# Altium schematic sheet U_eMMC.SchDoc
size A4; SheetNumber: 5; SheetTotal: 9
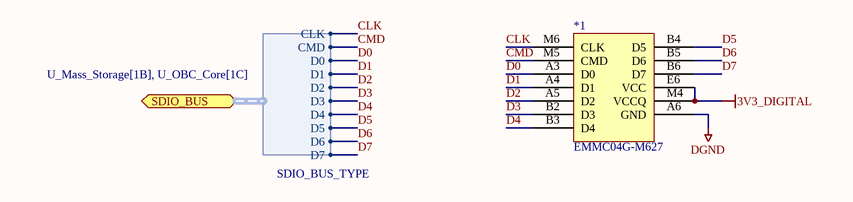
[diagram p0: U_eMMC.SchDoc]

## Parts
*1  EMMC04G-M627

## Ports
SDIO_BUS (bidir, harness SDIO_BUS_TYPE, see U_Mass_Storage[1B], U_OBC_Core[1C])

## Harnesses
SDIO_BUS_TYPE: CLK, CMD, D0, D1, D2, D3, D4, D5, D6, D7

## Nets
3V3_DIGITAL: *1.E6(VCC) *1.M4(VCCQ)
DGND: *1.A6(GND)
CLK: *1.M6(CLK) ; port SDIO_BUS.CLK
CMD: *1.M5(CMD) ; port SDIO_BUS.CMD
D0: *1.A3(D0) ; port SDIO_BUS.D0
D1: *1.A4(D1) ; port SDIO_BUS.D1
D2: *1.A5(D2) ; port SDIO_BUS.D2
D3: *1.B2(D3) ; port SDIO_BUS.D3
D4: *1.B3(D4) ; port SDIO_BUS.D4
D5: *1.B4(D5) ; port SDIO_BUS.D5
D6: *1.B5(D6) ; port SDIO_BUS.D6
D7: *1.B6(D7) ; port SDIO_BUS.D7